# Altium schematic sheet 32_Magnetor.SchDoc
size A4; SheetNumber: 8; SheetTotal: 16
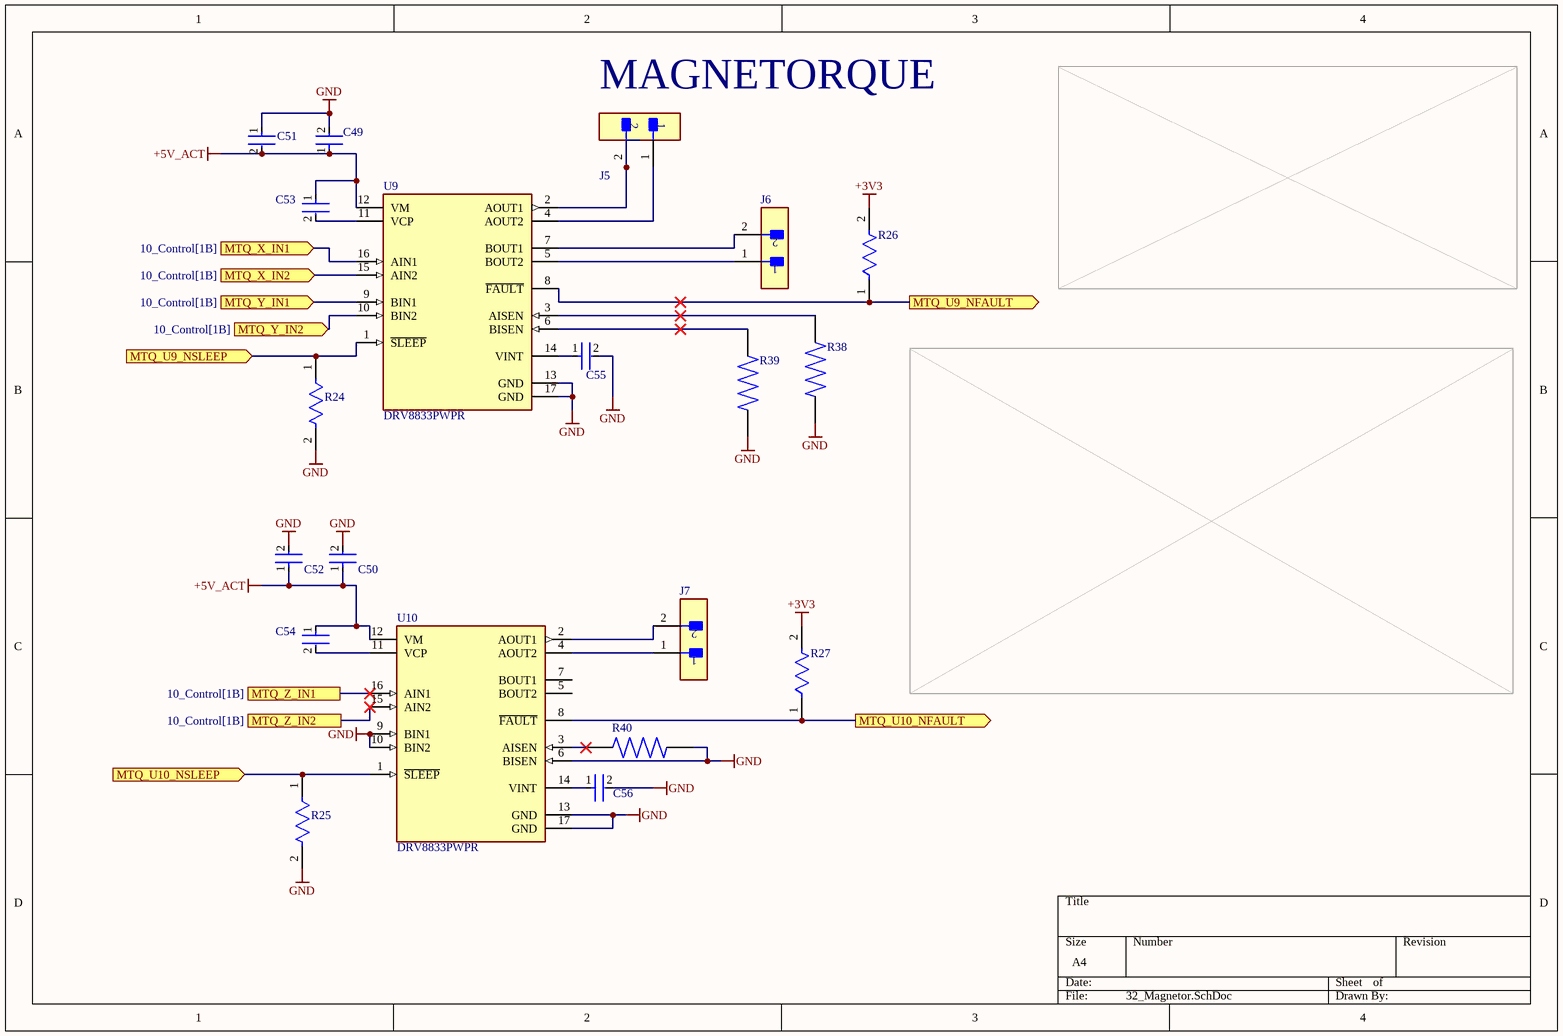
[diagram p0: 32_Magnetor.SchDoc]

## Parts
C49  C0603C104K3RACTU  [FP-C0603C-CF-IPC_B]  (value not drawn)
C50  C0603C104K3RACTU  [FP-C0603C-CF-IPC_B]  (value not drawn)
C51  GRM21BR71A106KA73L  [FP-GRM21B-0_15-MFG]  (value not drawn)
C52  GRM21BR71A106KA73L  [FP-GRM21B-0_15-MFG]  (value not drawn)
C53  C0603C103K3RACTU  [FP-C0603C-CF-IPC_B]  (value not drawn)
C54  C0603C103K3RACTU  [FP-C0603C-CF-IPC_B]  (value not drawn)
C55  GRM188R71A225KE15D  [FP-GRM188-0_1-e0_2_0_5-IPC_A]  (value not drawn)
C56  GRM188R71A225KE15D  [FP-GRM188-0_1-e0_2_0_5-IPC_A]  (value not drawn)
J5  53047-0210  [FP-53047-0210-MFG]  (value not drawn)
J6  53047-0210  [FP-53047-0210-MFG]  (value not drawn)
J7  53047-0210  [FP-53047-0210-MFG]  (value not drawn)
R24  RC0603FR-0747KL  [FP-RC0603FR-0747KL-MFG]  (value not drawn)
R25  RC0603FR-0747KL  [FP-RC0603FR-0747KL-MFG]  (value not drawn)
R26  RC0603FR-0710KL  [FP-RC0603-0_55-IPC_B]  (value not drawn)
R27  RC0603FR-0710KL  [FP-RC0603-0_55-IPC_B]  (value not drawn)
R38  RL1206FR-070R4L  [RESC3116X65N]  (value not drawn)
R39  RL1206FR-070R4L  [RESC3116X65N]  (value not drawn)
R40  RL1206FR-070R4L  [RESC3116X65N]  (value not drawn)
U9  DRV8833PWPR  [FP-PWP0016C-IPC_A]
U10  DRV8833PWPR  [FP-PWP0016C-IPC_A]

## Ports
MTQ_U9_NFAULT (out), MTQ_U9_NSLEEP (in), MTQ_U10_NFAULT (out), MTQ_U10_NSLEEP (in), MTQ_X_IN1 (in, see 10_Control[1B]), MTQ_X_IN2 (in, see 10_Control[1B]), MTQ_Y_IN1 (in, see 10_Control[1B]), MTQ_Y_IN2 (in, see 10_Control[1B]), MTQ_Z_IN1 (see 10_Control[1B]), MTQ_Z_IN2 (see 10_Control[1B])

## Nets
+3V3: R26.2 R27.2
+5V_ACT: C49.1 C50.1 C51.2 C52.1 C53.1 C54.1 U9.12(VM) U10.12(VM)
GND: C49.2 C50.2 C51.1 C52.2 C55.2 C56.2 R24.2 R25.2 R38.1 R39.1 R40.2 U9.13(GND) U9.17(GND) U10.6(BISEN) U10.9(BIN1) U10.10(BIN2) U10.13(GND) U10.17(GND)
MTQ_U9_NFAULT: R26.1 U9.8(~{FAULT}) ; port MTQ_U9_NFAULT
MTQ_U9_NSLEEP: R24.1 U9.1(~{SLEEP}) ; port MTQ_U9_NSLEEP
MTQ_U10_NFAULT: R27.1 U10.8(~{FAULT}) ; port MTQ_U10_NFAULT
MTQ_U10_NSLEEP: R25.1 U10.1(~{SLEEP}) ; port MTQ_U10_NSLEEP
MTQ_X_IN1: U9.16(AIN1) ; port MTQ_X_IN1
MTQ_X_IN2: U9.15(AIN2) ; port MTQ_X_IN2
MTQ_Y_IN1: U9.9(BIN1) ; port MTQ_Y_IN1
MTQ_Y_IN2: U9.10(BIN2) ; port MTQ_Y_IN2
MTQ_Z_IN1: U10.16(AIN1) ; port MTQ_Z_IN1
MTQ_Z_IN2: U10.15(AIN2) ; port MTQ_Z_IN2
NetC53_2: C53.2 U9.11(VCP)
NetC54_2: C54.2 U10.11(VCP)
NetC55_1: C55.1 U9.14(VINT)
NetC56_1: C56.1 U10.14(VINT)
NetJ5_1: J5.1 U9.4(AOUT2)
NetJ5_2: J5.2 U9.2(AOUT1)
NetJ6_1: J6.1 U9.5(BOUT2)
NetJ6_2: J6.2 U9.7(BOUT1)
NetJ7_1: J7.1 U10.4(AOUT2)
NetJ7_2: J7.2 U10.2(AOUT1)
NetR38_2: R38.2 U9.3(AISEN)
NetR39_2: R39.2 U9.6(BISEN)
NetR40_1: R40.1 U10.3(AISEN)

Not connected (* = marked no-connect by the designer): U10 5(BOUT2) 7(BOUT1)

## Notes on the sheet
- (near J5) MAGNETORQUE

## Library data of the parts
C49 C50 = CMP-2006-03057-2: CAP CER 0.1UF 25V X7R 0603; Manufacturer: KEMET; Value: 0.10 μF; Material: Ceramic; Tolerance: 0.1; Temperature Coefficient: 30ppm/°C; Automotive Grade: Grade 1; Lead Free: Yes; Device Class L3: Ceramic Capacitors; Voltage Rating: 25 V; Manufacturer Part Number: C0603C104K3RACTU; Digikey Description: CAP CER 0.1UF 25V X7R 0603; Mouser Description: Multilayer Ceramic Capacitors MLCC - SMD/SMT 25volts 0.1uF X7R 10%; Package: C0603C-CF; Temperature Range Low: -55°C; Automotive: Yes; Device Class L2: Capacitors; Octopart: https://octopart.com/c0603c104k3ractu-kemet-127541; ComponentLink2Description: Datasheet; ComponentLink2URL: https://api.kemet.com/component-edge/download/datasheet/C0603C100J5GACAUTO.pdf; Temperature Range High: +125°C; RoHS: TRUE; Device Class L1: Passive Components; Category: Cap; Temperature: -55°C to +125°C; Capacitance: 0.10 μF; Height: 0.87mm; Temperature Characteristic: X7R
C51 C52 = CMP-2000-07555-2: Chip Multilayer Ceramic Capacitors for General Purpose, 0805, 10uF, X7R, 15%, 10%, 10V; Length: 2mm; Case Code (Metric): 2012; Height: 1.25mm; Tolerance: 10%; Width: 1.25mm; Voltage Rating: 10V; Voltage Rating (DC): 10V; Case/Package: 0805; Package Quantity: 3000; Capacitance: 10uF; REACH SVHC: No SVHC; Case Code (Imperial): 0805; Min Operating Temperature: -55°C; Termination: SMD/SMT; Depth: 1.25mm; Mount: Surface Mount; Thickness: 0.055inch; Max Operating Temperature: 125°C; Weight: 0.000335oz; Dielectric: X7R; Packaging: Tape and Reel
C53 C54 = CMP-2006-03040-2: CAP CER 10000PF 25V 10% X7R 0603; Manufacturer: KEMET; Material: Ceramic; Capacitance: 10,000 pF; Value: 10,000 pF; Tolerance: 0.1; Automotive Grade: Grade 1; Temperature Coefficient: 30ppm/°C; Lead Free: Yes; Temperature Range High: +125°C; Temperature Characteristic: X7R; Device Class L2: Capacitors; Mouser Description: Multilayer Ceramic Capacitors MLCC - SMD/SMT 25volts 10000pF X7R 10%; ComponentLink2Description: Datasheet; Height: 0.87mm; Digikey Description: CAP CER 10000PF 25V 10% X7R 0603; ComponentLink2URL: https://api.kemet.com/component-edge/download/datasheet/C0603C100J5GACAUTO.pdf; Octopart: https://octopart.com/c0603c103k3ractu-kemet-89103; Category: Cap; Package: C0603C-CF; Voltage Rating: 25 V; Device Class L3: Ceramic Capacitors; Automotive: Yes; RoHS: TRUE; Temperature: -55°C to +125°C; Temperature Range Low: -55°C; Device Class L1: Passive Components; Manufacturer Part Number: C0603C103K3RACTU
C55 C56 = CMP-2006-02836-2: Chip Multilayer Ceramic Capacitors for General Purpose, 0603, 2.2uF, X7R, 15%, 10%, 10V; Case Code (Metric): 1608; Height: 0.8mm; Packaging: Cut Tape; Voltage: 10V; Lead Free: Lead Free; Min Operating Temperature: -55°C; Voltage Rating (DC): 10V; Max Operating Temperature: 125°C; Voltage Rating: 10V; Dielectric: X7R; Depth: 0.8mm; Case Code (Imperial): 0603; Termination: SMD/SMT; Case/Package: 0603; Number of Pins: 2; REACH SVHC: No SVHC; Mount: Surface Mount; Width: 0.031inch; Material: Ceramic; Capacitance: 2.2uF; Package Quantity: 1; Weight: 7.1E-05oz; Length: 1.6mm; Thickness: 0.035inch; Tolerance: 10%
J5-J7 = CMP-2000-05628-3: CONN HEADER VERT 2POS 1.25MM; Manufacturer: Molex; Conn Gender: Male; Voltage Rating: 125V; Conn Orientation: Vertical; Number Of Contacts: 2; Current Rating: 1A; Contact Material: Tin; Temperature Range Low: -40°C; ComponentLink2URL: http://www.molex.com/webdocs/datasheets/pdf/en-us/0530470210_PCB_HEADERS.pdf; Mouser Description: 1.25mm Pitch PicoBlade™ Wire-to-Board Header, Vertical, with Friction Lock, 2 Circuits; Manufacturer Part Number: 53047-0210; Temperature Range High: +85°C; ComponentLink2Description: Datasheet; Automotive: No; RoHS: TRUE; Ambient Temperature Range High: +85°C; Octopart: https://octopart.com/53047-0210-molex-276772; Footprint Url: https://www.molex.com/pdm_docs/sd/530470210_sd.pdf; Lead Free: Yes; Pitch: 1.25mm; Temperature: -40°C to +85°C; Device Class L2: Headers and Wire Housings; Package: 0; Ambient Temperature Range Low: -40°C; Digikey Description: CONN HEADER VERT 2POS 1.25MM; Category: Conn; Device Class L3: unset; Number Of Rows: 1; Device Class L1: Connectors; Height: 4.4mm
R24 R25 = CMP-1659-00055-2: RES SMD 47K OHM 1% 1/10W 0603; Voltage Rating: 50V; Temperature Coefficient: 100ppm/°C; Max Power Dissipation: 100mW; Resistance: 47kR; Voltage Rating (DC): 50V; Min Operating Temperature: -55°C; Packaging: Tape and Reel; Features: Moisture Resistant; Termination: SMD/SMT; Technology: THICK FILM; Lead Free: Lead Free; Max Operating Temperature: 155°C; Width: 0.031inch; Case Code (Metric): 1608; Tolerance: 1%; Package Quantity: 1; Resistor Type: Thick Film; RoHS Compliant: Yes; Case/Package: 0603; Case Code (Imperial): 0603; Resistance Tolerance: 1%; Length: 0.063inch; Series: RC; Number of Pins: 2; Power Rating: 100mW; Number of Terminations: 2; Construction: Rectangular; Height: 0.022inch; Military Standard: Not; Size Code: 0603; Depth: 0.8mm
R26 R27 = CMP-2100-03664-2: RES 10K OHM 1% 1/10W 0603; Voltage Rating: 75V; Voltage Rating (DC): 50V; Resistance: 10kR; Power Rating: 100mW; Temperature Coefficient: 100ppm/°C; Depth: 0.8mm; Termination: SMD/SMT; Resistor Type: Thick Film; Series: RC; Construction: Rectangular; Features: Moisture Resistant; Packaging: Tape and Reel; Min Operating Temperature: -55°C; Number of Terminations: 2; Lead Pitch: 0.3mm; RoHS Compliant: Yes; Case/Package: 0603; Resistance Tolerance: 1%; Military Standard: Not; Weight: 7.1E-05oz; Number of Pins: 2; Tolerance: 1%; Length: 1.6mm; Case Code (Imperial): 0603; Lead Free: Lead Free; Width: 0.8mm; Max Power Dissipation: 100mW; Height: 0.45mm; Max Operating Temperature: 155°C; Case Code (Metric): 1608; Size Code: 0603
R38-R40 = RL1206FR-070R4L: 400 mOhms Â±1% 0.25W, 1/4W Chip Resistor 1206 (3216 Metric) Automotive AEC-Q200, Current Sense, Moisture Resistant Thick Film; MF: Yageo; SnapEDA_Link: https://www.snapeda.com/parts/RL1206FR-070R4L/Yageo/view-part/?ref=snap; Package: 3116 Yageo; Value: *; MP: RL1206FR-070R4L; Check_prices: https://www.snapeda.com/parts/RL1206FR-070R4L/Yageo/view-part/?ref=eda
U9 U10 = CMP-1529-00004-3: IC MOTOR DRIVER PAR 16HTSSOP; Supply Current: 3mA; Max Output Current: 2A; Interface: PWM; Output Current: 1.5A; Max Supply Voltage: 10.8V; Fault Protection: Over Temperature; Number of Outputs: 2; Min Supply Voltage: 2.7V; Nominal Supply Current: 3mA; Series: DRV8833; Min Operating Temperature: -40°C; Package Quantity: 2000; Packaging: Tape and Reel; Case/Package: HTSSOP; Output Current per Channel: 1.5A; RoHS Compliant: Yes; RMS Current (Irms): 1.5A; Max Operating Temperature: 85°C; Technology: NMOS; Number of Pins: 16; Radiation Hardening: No; Lead Free: Lead Free; REACH SVHC: No SVHC